# EAGLE design source_eagle (EAGLE 6.6.0)
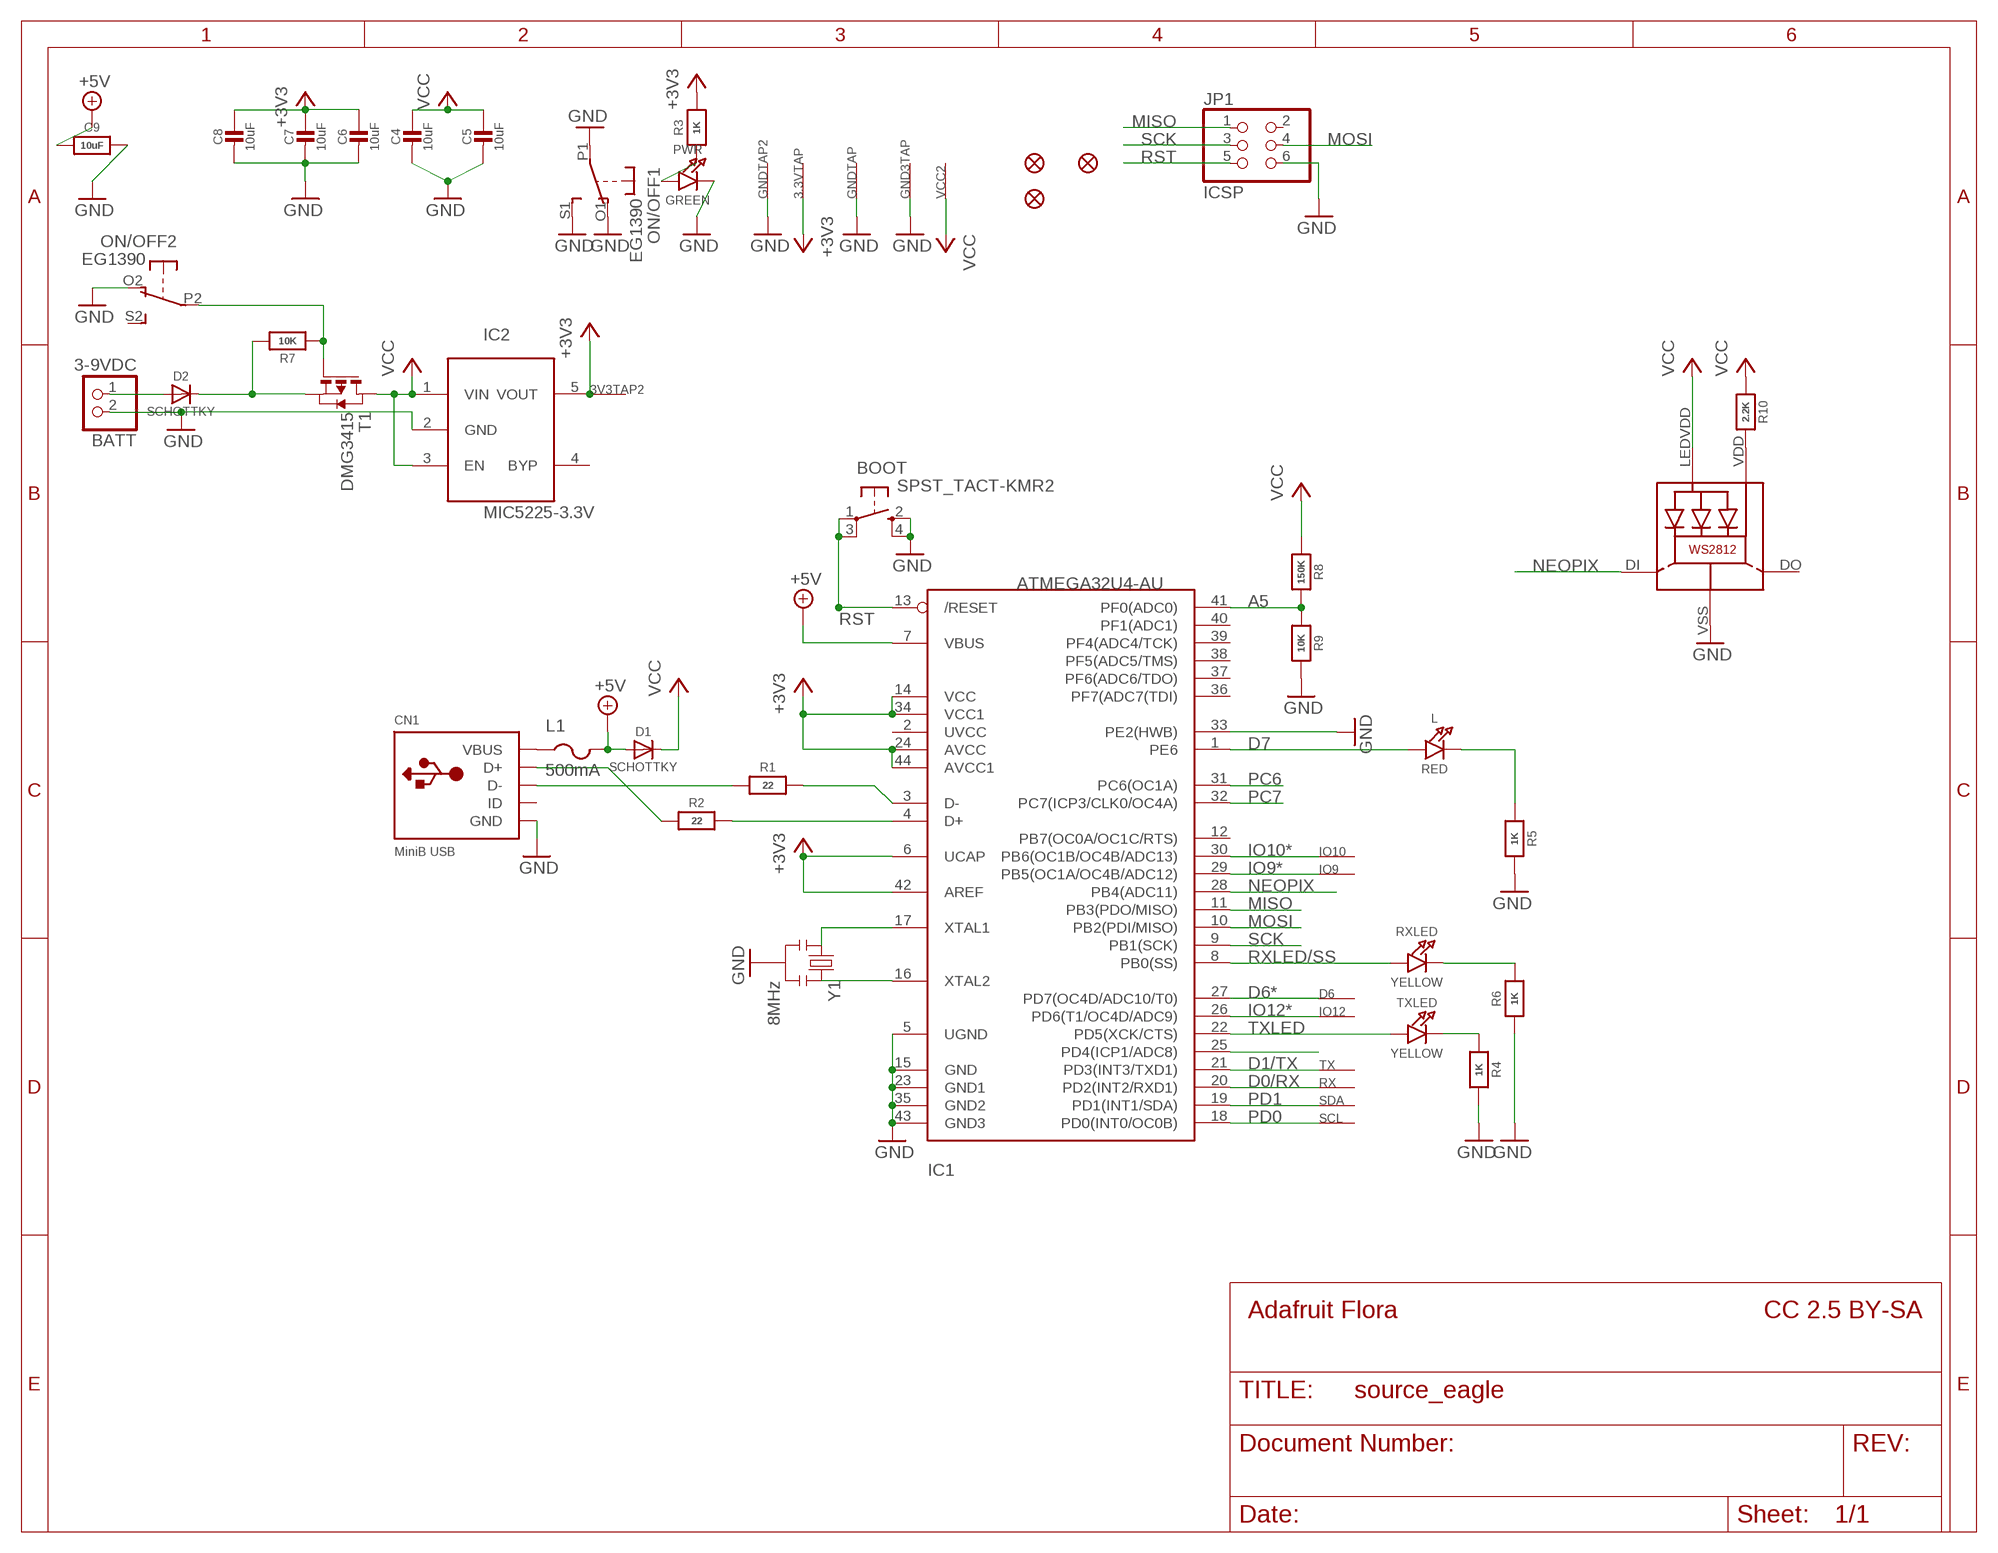
[diagram p0: schematic, sheet 1]

## Parts
3.3VTAP  SEWTAP-2.0IN  [SEWINGTAP_2.0]
3V3TAP2  SEWTAP-2.0IN  [SEWINGTAP_2.0]
BATT  3-9VDC  JST_2PIN-SMT-RA  [JST-PH-2-SMT-RA]
BOOT  SPST_TACT-KMR2  [KMR2]
C4  10uF  CAP_CERAMIC0805-NOOUTLINE  [0805-NO]
C5  10uF  CAP_CERAMIC0805-NOOUTLINE  [0805-NO]
C6  10uF  CAP_CERAMIC0805-NOOUTLINE  [0805-NO]
C7  10uF  CAP_CERAMIC0805-NOOUTLINE  [0805-NO]
C8  10uF  CAP_CERAMIC0805-NOOUTLINE  [0805-NO]
C9  10uF  RESISTOR_0805MP  [_0805MP]
CN1  MiniB USB  USBMICRO_20329  [4UCONN_20329]
D1  SCHOTTKY  DIODESOD-123  [SOD-123]
D2  SCHOTTKY  DIODESOD-123  [SOD-123]
D6  SEWTAP-2.0IN  [SEWINGTAP_2.0]
GND3TAP  SEWTAP-2.0IN  [SEWINGTAP_2.0]
GNDTAP  SEWTAP-2.0IN  [SEWINGTAP_2.0]
GNDTAP2  SEWTAP-2.0IN  [SEWINGTAP_2.0]
IC1  ATMEGA32U4-AU  [TQFP44]
IC2  MIC5225-3.3V  LP298XS  [SOT23-5L]
IO9  SEWTAP-2.0IN  [SEWINGTAP_2.0]
IO10  SEWTAP-2.0IN  [SEWINGTAP_2.0]
IO12  SEWTAP-2.0IN  [SEWINGTAP_2.0]
JP1  ICSP  PINHD-2X3  [2X03]
L  RED  LED0805_NOOUTLINE  [CHIPLED_0805_NOOUTLINE]
L1  500mA  PTCFUSE-1206  [R1206]
LED1  WS2812  [WS2812]
ON/OFF  EG1390  DPDT-EG1390  [EG1390]
PWR  GREEN  LED0805_NOOUTLINE  [CHIPLED_0805_NOOUTLINE]
R1  22  RESISTOR0805_NOOUTLINE  [0805-NO]
R2  22  RESISTOR0805_NOOUTLINE  [0805-NO]
R3  1K  RESISTOR_0805MP  [_0805MP]
R4  1K  RESISTOR_0805MP  [_0805MP]
R5  1K  RESISTOR0805_NOOUTLINE  [0805-NO]
R6  1K  RESISTOR0805_NOOUTLINE  [0805-NO]
R7  10K  RESISTOR_0805MP  [_0805MP]
R8  150K  RESISTOR0805_NOOUTLINE  [0805-NO]
R9  10K  RESISTOR0805_NOOUTLINE  [0805-NO]
R10  2.2K  RESISTOR0805_NOOUTLINE  [0805-NO]
RX  SEWTAP-2.0IN  [SEWINGTAP_2.0]
RXLED  YELLOW  LED0805_NOOUTLINE  [CHIPLED_0805_NOOUTLINE]
SCL  SEWTAP-2.0IN  [SEWINGTAP_2.0]
SDA  SEWTAP-2.0IN  [SEWINGTAP_2.0]
T1  DMG3415  PMOSSOT23  [SOT-23]
TX  SEWTAP-2.0IN  [SEWINGTAP_2.0]
TXLED  YELLOW  LED0805_NOOUTLINE  [CHIPLED_0805_NOOUTLINE]
U$2  FIDUCIAL""  [FIDUCIAL_1MM]
U$3  FIDUCIAL""  [FIDUCIAL_1MM]
U$6  FIDUCIAL""  [FIDUCIAL_1MM]
VCC2  SEWTAP-2.0IN  [SEWINGTAP_2.0]
Y1  8MHz  RESONATORSMD  [RESONATOR-SMD]

## Nets
+3V3: 3.3VTAP.P$1(SEW) 3V3TAP2.P$1(SEW) C6.1 C7.1 C8.1 IC1.6(UCAP) IC1.14(VCC) IC1.24(AVCC) IC1.34(VCC1) IC1.42(AREF) IC1.44(AVCC1) IC2.5(VOUT) R3.2
+5V: C9.1 D1.A IC1.7(VBUS) L1.2
A5: IC1.41(PF0(ADC0)) R8.2 R9.1
D0/RX: IC1.20(PD2(INT2/RXD1)) RX.P$1(SEW)
D1/TX: IC1.21(PD3(INT3/TXD1)) TX.P$1(SEW)
D6*: D6.P$1(SEW) IC1.27(PD7(OC4D/ADC10/T0))
D7: IC1.1(PE6) L.A
GND: BATT.2 BOOT.2(S) BOOT.4(S1) C4.2 C5.2 C6.2 C7.2 C8.2 C9.2 CN1.BASE@1(GND) CN1.BASE@2(GND) CN1.GND CN1.SPRT@1(GND) CN1.SPRT@2(GND) CN1.SPRT@3(GND) CN1.SPRT@4(GND) GND3TAP.P$1(SEW) GNDTAP2.P$1(SEW) GNDTAP.P$1(SEW) IC1.5(UGND) IC1.15(GND) IC1.23(GND1) IC1.33(PE2(HWB)) IC1.35(GND2) IC1.43(GND3) IC2.2(GND) JP1.6 LED1.VSS(GND) ON/OFF.O1(1:O) ON/OFF.O2(2:O) ON/OFF.P1(1:P) ON/OFF.S1(1:S) PWR.C R4.2 R5.2 R6.1 R9.2 Y1.2
IO9*: IC1.29(PB5(OC1A/OC4B/ADC12)) IO9.P$1(SEW)
IO10*: IC1.30(PB6(OC1B/OC4B/ADC13)) IO10.P$1(SEW)
IO12*: IC1.26(PD6(T1/OC4D/ADC9)) IO12.P$1(SEW)
MISO: IC1.11(PB3(PDO/MISO)) JP1.1
MOSI: IC1.10(PB2(PDI/MISO)) JP1.4
N$1: PWR.A R3.1
N$2: CN1.D+ R2.1
N$3: IC1.3(D-) R1.2
N$4: IC1.4(D+) R2.2
N$5: CN1.D- R1.1
N$6: D2.C R7.2 T1.2(S)
N$7: BATT.1 D2.A
N$8: IC1.17(XTAL1) Y1.1
N$9: IC1.16(XTAL2) Y1.3
N$10: L.C R5.1
N$11: R4.1 TXLED.C
N$12: R6.2 RXLED.C
N$13: ON/OFF.P2(2:P) R7.1 T1.3(G)
N$14: LED1.VDD R10.2
N$15: IC1.25(PD4(ICP1/ADC8))
NEOPIX: IC1.28(PB4(ADC11)) LED1.DI
PC6: IC1.31(PC6(OC1A))
PC7: IC1.32(PC7(ICP3/CLK0/OC4A))
PD0: IC1.18(PD0(INT0/OC0B)) SCL.P$1(SEW)
PD1: IC1.19(PD1(INT1/SDA)) SDA.P$1(SEW)
RST: BOOT.1(P) BOOT.3(P1) IC1.13(/RESET) JP1.5
RXLED/SS: IC1.8(PB0(SS)) RXLED.A
SCK: IC1.9(PB1(SCK)) JP1.3
TXLED: IC1.22(PD5(XCK/CTS)) TXLED.A
VBUS: CN1.VBUS L1.1
VCC: C4.1 C5.1 D1.C IC2.1(VIN) IC2.3(EN) LED1.LEDVDD R8.1 R10.1 T1.1(D) VCC2.P$1(SEW)
Unconnected: CN1.ID IC1.2(UVCC) IC1.12(PB7(OC0A/OC1C/RTS)) IC1.36(PF7(ADC7(TDI)) IC1.37(PF6(ADC6/TDO)) IC1.38(PF5(ADC5/TMS)) IC1.39(PF4(ADC4/TCK)) IC1.40(PF1(ADC1)) IC2.4(BYP) JP1.2 LED1.DO ON/OFF.S2(2:S)

## Notes on the sheet
- Adafruit Flora | CC 2.5 BY-SA

## Library data of the parts
3.3VTAP 3V3TAP2 D6 GND3TAP GNDTAP GNDTAP2 IO9 IO10 IO12 RX SCL SDA TX VCC2 = adafruit:SEWTAP
BATT = adafruit:JST_2PIN: JST 2-Pin Connectors of various flavors SMT-RA (S2B-PH-SM4) 4UConnector #17311 SMT (B2B-PH-SM4) THM-RA (S2B-PH) THM (B2B-PH)
BOOT = adafruit:SPST_TACT: SMT 6mm switch, EVQQ2 series http://www.ladyada.net/library/eagle
C4-C8 = microbuilder:CAP_CERAMIC: Ceramic Capacitors For new designs, use the packages preceded by an '_' character since they are more reliable: The following footprints should be used on most boards: _0402 - Standard footprint for regular board layouts _0603 - Standard footprint for regular board layouts _0805 - Standard footprint for regular board layouts _1206 - Standard footprint for regular board layouts For extremely tight-pitch boards where space is at a premium, the following 'micro-pitch' footprints can be used (smaller pads, no silkscreen outline, etc.): _0402MP - Micro-pitch footprint for very dense/compact boards _0603MP - Micro-pitch footprint for very dense/compact boards _0805MP - Micro-pitch footprint for very dense/compact boards _1206MP - Micro-pitch footprint for very dense/compact boards
C9 R1-R10 = microbuilder:RESISTOR: Resistors For new designs, use the packages preceded by an '_' character since they are more reliable: The following footprints should be used on most boards: _0402 - Standard footprint for regular board layouts _0603 - Standard footprint for regular board layouts _0805 - Standard footprint for regular board layouts _1206 - Standard footprint for regular board layouts For extremely tight-pitch boards where space is at a premium, the following 'micro-pitch' footprints can be used (smaller pads, no silkscreen outline, etc.): _0402MP - Micro-pitch footprint for very dense/compact boards _0603MP - Micro-pitch footprint for very dense/compact boards _0805MP - Micro-pitch footprint for very dense/compact boards _1206MP - Micro-pitch footprint for very dense/compact boards
CN1 = microbuilder:USB: USB Connectors USBMINIB - Surface Mount Female Mini-B USB Connector 4UConnector: 06564
D1 D2 = microbuilder:DIODE: Diode SMA Model Volts Amps Type Vf Ir Digikey # Notes SSA34-E3 40V 3A Schottky 480mV @ 3A 200uA @ 40V SSA34-E3/61TGITR-ND CDBA120-G 20V 1A Schottky 500mV @ 1A 500uA @ 20V 641-1014-6-ND REEL MBRA210 10V 2A Schottky 350mV @ 2A 700uA @ 10V MBRA210LT3 SOD-123 Model Volts Amps Type Vf Ir Order # Notes BAT54T1G 30V 200mA Schottky 800mV @ 200mA 2uA @ 25V BAT54T1GOSTR-ND B0530W 30V 500mA Schottky 430mV @ 500mA 130uA @ 30V B0530W-FDICT-ND REEL MBR120 20V 1A Schottky 340mV @ 1A MBR120VLSFT1GOSCT-ND SOD-323 Model Volts Amps Type Vf Ir Order # Notes PMEG2005EJ 20V 500mA Schottky 355mV @ 500mA 568-4110-1-ND ZLLS410 10V 570mA Schottky 380mV @ 570mA ZLLS410CT-ND 1N4148WS 75V 150mA Silicon/Simple 1V 1N4148WSFSCT-ND REEL SOD-523 Model Volts Amps Type Vf Ir Order # Notes BAT54XV2 30V 200mA Schottky 0.8V @ 100mA BAT54XV2CT-ND TB751S 30V 30mA Schottky RB751S-40TE61CT-ND SOT23-R/W (R = Solder Paste/Reflow Ovens, W = Hand-Soldering) Model Volts Amps Type Vf Ir Order # Notes BAT54FILM 40V 300mA Schottky 497-7162-1-ND POWERDI-5 Model Volts Amps Type Vf Ir Order # Notes PDS560 60V 5A Schottky 670mV @ 5A 150uA @ 60V PDS560DICT-ND
IC1 = adaprog:ATMEGA32U4
IC2 = adafruit:LP298X
JP1 = pinhead:PINHD-2X3: PIN HEADER
L PWR RXLED TXLED = microbuilder:LED: LED 0603 - 0603 Surface Mount Package 2mA: Green LED - Low Power (3.9mcd, 2ma, 1.7Vf) - Digikey: 475-2709-2-ND Orange LED - Low Power (9.8mcd, 2ma, 1.8Vf) - Digikey: 475-1194-2-ND Red LED - Low Power (5mcd, 2ma, 1.8Vf) - Digikey: 475-1195-2-ND Yellow LED - Low Power (7mcd, 2ma, 1.8Vf) - Digikey: 475-1196-2-ND 5mA: Blue LED - Low Power (17mcd, 5ma, 2.9Vf) - Digikey: LNJ937W8CRACT-ND 0805 - 0805 Surface Mount Package 2mA: Red LED (8.8mcd, 2mA, 1.8Vf, Clear) - Low Power [Digikey: 475-2510-1-ND] Green LED (5mcd, 2mA, 1.8Vf, Clear) - Low Power [Digikey: 475-2730-1-ND] Yellow LED (11.3mcd, 2mA, 1.8Vf, Clear) - Low Power [Digikey: 475-2555-1-ND] 20mA: Red LED (104mcd, 20mA, Diffused) - LS R976 [Digikey: 475-1278-6-ND] Red LED (12mcd, 20mA, 2.0Vf, Clear) - APT2012EC [Digikey: 754-1128-1-ND] Green LED (15mcd, 20mA, 2.2Vf, Clear) - APT2012GC [Digikey: 754-1131-1-ND] Orange LED (160mcd, 20mA, 2.1Vf, Clear) - APT2012SECK [Digikey: 754-1130-1-ND] 1206 - 1206 Surface Mount Package Green LED (26mcd, 20mA, Diffused) - LG N971 [Digikey: 475-1407-6-ND] Red LED (15mcd, 20mA, Diffused) - LH N974 [Digikey: 475-1416-6-ND] Cree - Cree High-Power Surface Mount LEDs XPEBWT-L1-0000-00D50 - White 111lm 350mA 2.9Vf 6200K 110° XTEAWT-00-0000-00000LEE3 - White 114lm 350mA 2.85Vf 5000K 115° Everlight - Everlight 45-21 Series Surface Mount LEDs 45-21/QK2C-B2832AC2CB2/2T - Warm White 2000mcd 20mA 3.25Vf 3050K 120° 45-21/LK2C-B38452C4CB2/2T - Nuetral White 2000mcd 20mA 3.25Vf 4150K 120° 45-21/LK2C-B50634C6CB2/2T - Cold White 2200mcd 20mA 3.25Vf 5650K 120° PLCC2 Reverse Mount LS T77K-J1L2-1-0-2-R18-Z - Red 11.25mcd 2mA 1.8Vf 630nm 120° LO T77K-L1M2-24-Z - Orange 19.6mcd 2mA 1.8Vf 606nm 120° LY T77K-K2M1-26-Z - Yellow 15.7mcd 2mA 1.8Vf 587nm 120°
L1 = adafruit:PTCFUSE: PTC fuses, resettable thermistors
LED1 = adafruit:WS2812
ON/OFF = adafruit:DPDT
T1 = zetex:PMOSSOT23: MOS FET; OC_FARNELL: unknown; OC_NEWARK: unknown
U$2 U$3 U$6 = microbuilder:FIDUCIAL: Fiducial Alignment Points Various fiducial points for machine vision alignment.; BOM: EXCLUDE
Y1 = SparkFun:RESONATOR: Resonator Small SMD resonator. This is the itty bitty 10/20MHz resonators with built in caps. CSTCE10M0G55 and CSTCE20M0V53. Footprint has been reviewed closely but hasn't been tested yet.

## Board
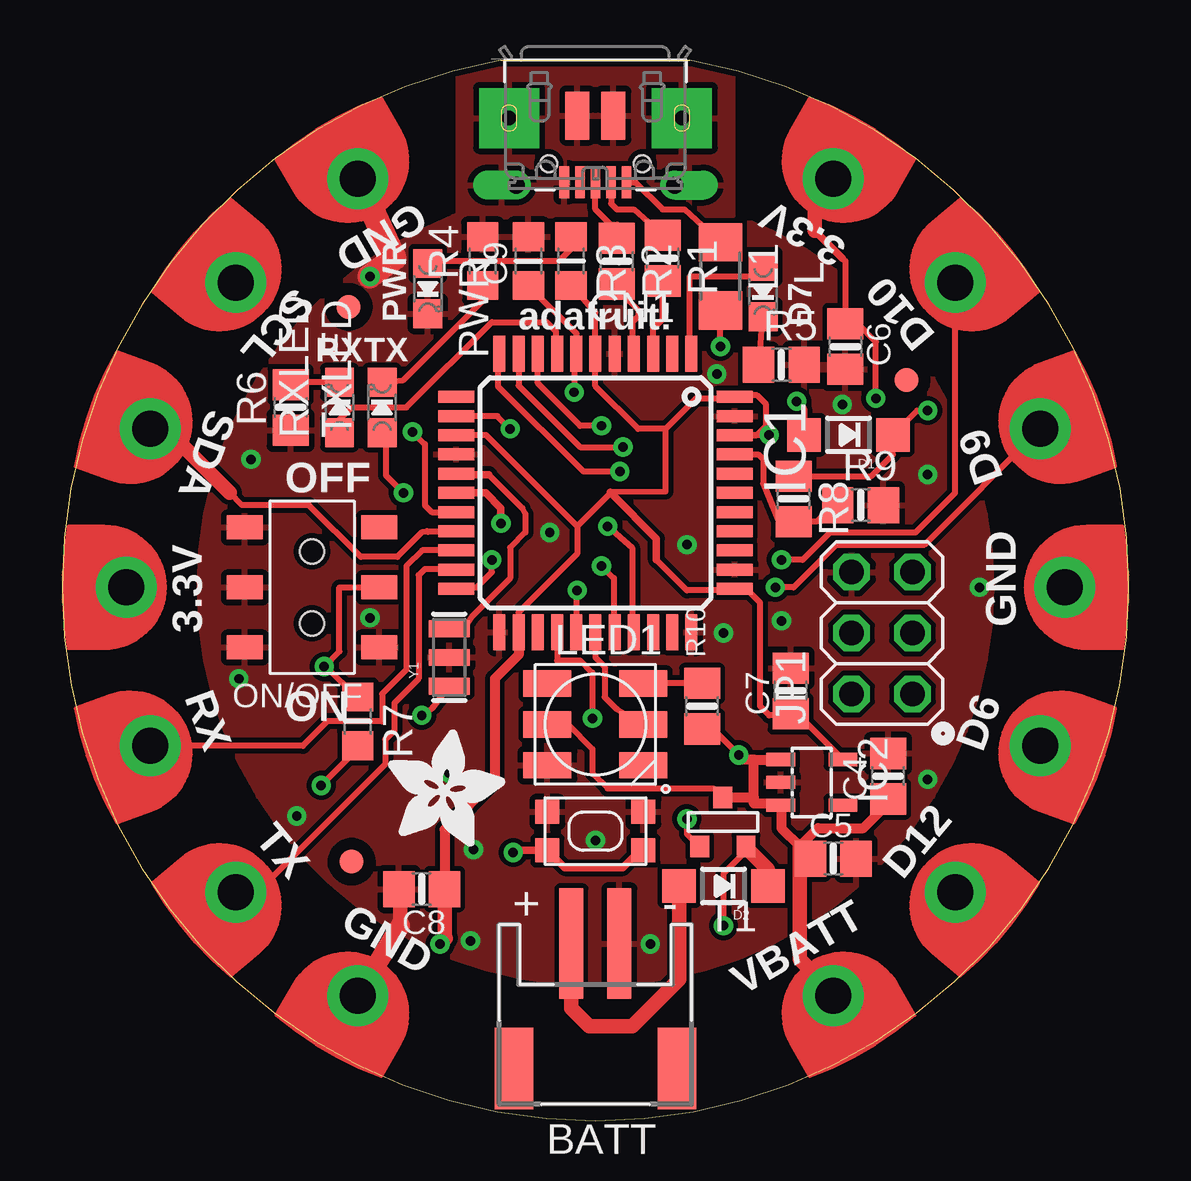
[diagram p1: board, top side]
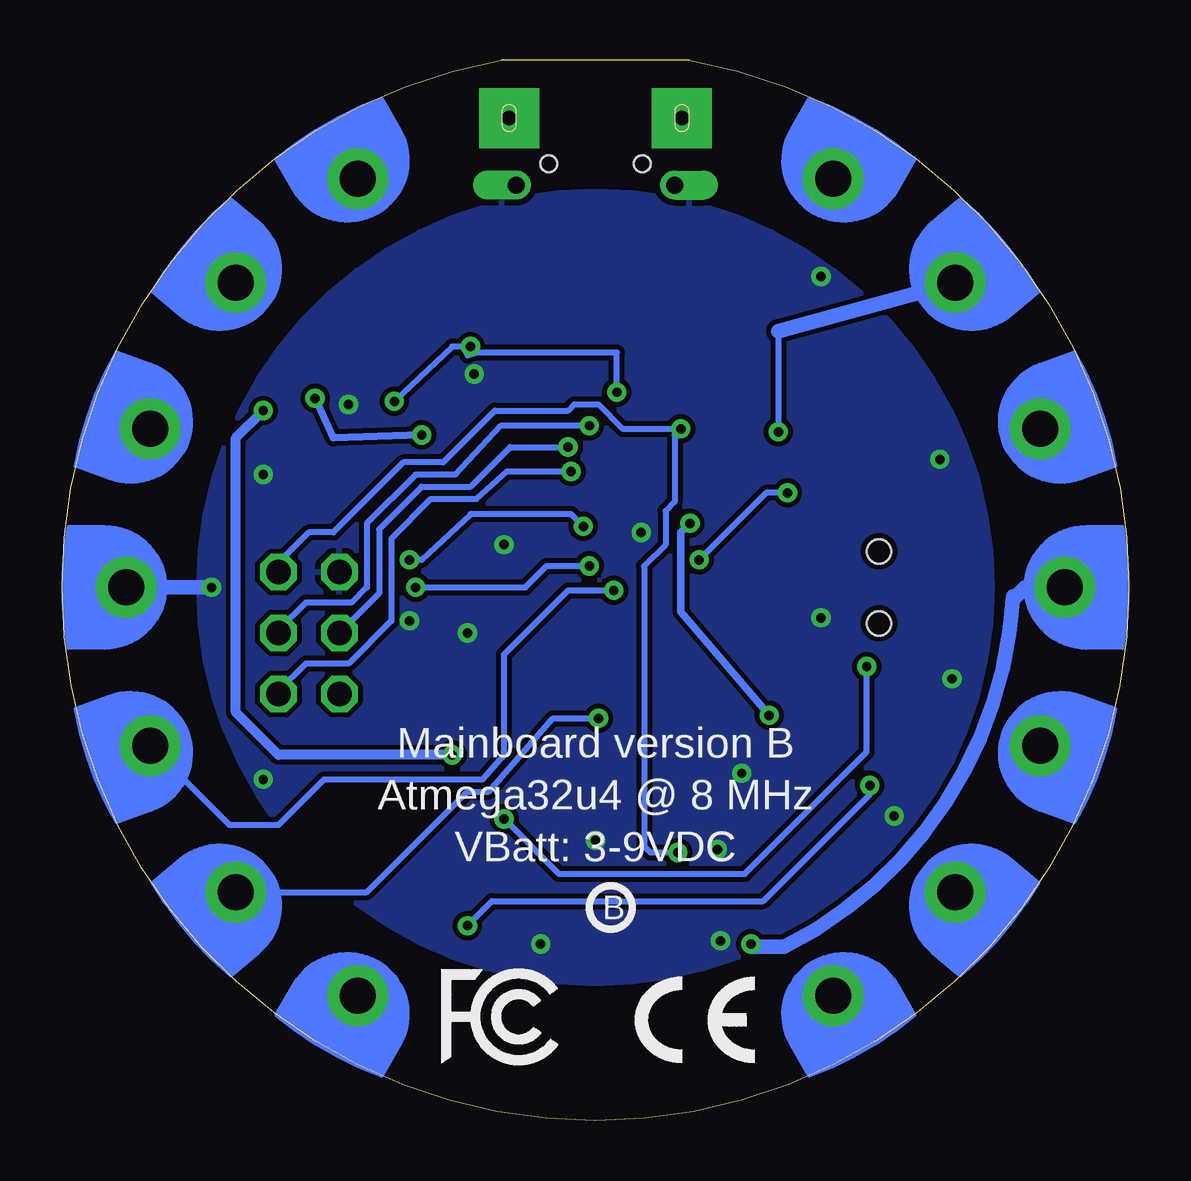
[diagram p2: board, bottom side, seen from below]

Size 44.45 x 44.2 mm. Coordinates in mm from the lower left corner, seen from the top.
Outline: 0,22.23 arc90 22.23,0 arc90 44.45,22.23 arc80 26.16,44.2 18.29,44.2 arc80 0,22.23
Copper layers (1*16): Top 0.035mm / dielectric 1.5mm / Bottom 0.035mm
Design rules "adafruit": minimum track width 8mil, minimum drill 15.5mil, track to track 8mil, track to pad 8mil, pad to pad 8mil, via to via 8mil, smd to smd 8mil, copper to edge 10mil, drill to drill 8mil, minimum pad ring 10mil, minimum via ring 8mil, stop-mask expansion 2mil, vias tented up to drill 20mil, thermal gap 10mil

### Footprints (pad centres in the part's own frame; a part is rotated, then mirrored left to right if it is on the bottom)
SEWINGTAP_2.0 = drill 1.5 pad 2.54: P$1 0,0
JST-PH-2-SMT-RA = smd 1 x 4.6: 1 1,-3.7; 2 -1,-3.7 | smd 1.6 x 3.4: NC1 -3.4,1.5; NC2 3.4,1.5
KMR2 = smd 1 x 1: 1 2,0.8; 2 2,-0.8; 3 -2,0.8; 4 -2,-0.8
0805-NO = smd 1.3 x 1.5: 1 -0.95,0; 2 0.95,0
_0805MP = smd 1.2 x 1.3: 1 -1.016,0; 2 1.016,0
4UCONN_20329 = smd 1 x 2: BASE@1 -0.75,-2; BASE@2 0.75,-2 | smd 0.4 x 1.35: D+ 0,0.775; D- -0.65,0.775; GND 1.3,0.775; ID 0.65,0.775; VBUS -1.3,0.775 | drill 0.7 offset: SPRT@1 -3.3,0.9; SPRT@2 3.3,0.9 | drill 0.6 pad 2.5 square: SPRT@3 -3.6,-1.9; SPRT@4 3.6,-1.9 | hole 0.7: -1.95,0; 1.95,0
SOD-123 = smd 1.4 x 1.4: A 1.85,0; C -1.85,0
TQFP44 = smd 1.5 x 0.5: 1 -5.8,4; 2 -5.8,3.2; 3 -5.8,2.4; 4 -5.8,1.6; 5 -5.8,0.8; 6 -5.8,0; 7 -5.8,-0.8; 8 -5.8,-1.6; 9 -5.8,-2.4; 10 -5.8,-3.2; 11 -5.8,-4; 23 5.8,-4; 24 5.8,-3.2; 25 5.8,-2.4; 26 5.8,-1.6; 27 5.8,-0.8; 28 5.8,0; 29 5.8,0.8; 30 5.8,1.6; 31 5.8,2.4; 32 5.8,3.2; 33 5.8,4 | smd 0.5 x 1.5: 12 -4,-5.8; 13 -3.2,-5.8; 14 -2.4,-5.8; 15 -1.6,-5.8; 16 -0.8,-5.8; 17 0,-5.8; 18 0.8,-5.8; 19 1.6,-5.8; 20 2.4,-5.8; 21 3.2,-5.8; 22 4,-5.8; 34 4,5.8; 35 3.2,5.8; 36 2.4,5.8; 37 1.6,5.8; 38 0.8,5.8; 39 0,5.8; 40 -0.8,5.8; 41 -1.6,5.8; 42 -2.4,5.8; 43 -3.2,5.8; 44 -4,5.8
SOT23-5L = smd 0.55 x 1.2: 1 -0.95,-1.3; 2 0,-1.3; 3 0.95,-1.3; 4 0.95,1.3; 5 -0.95,1.3
2X03 = drill 1.016 octagon: 1 -2.54,-1.27; 2 -2.54,1.27; 3 0,-1.27; 4 0,1.27; 5 2.54,-1.27; 6 2.54,1.27
CHIPLED_0805_NOOUTLINE = smd 1.2 x 1.2: A 0,-1.05; C 0,1.05
R1206 = smd 1.6 x 1.803: 1 -1.422,0; 2 1.422,0
WS2812 = smd 2 x 1.1: DI 2,0; DO 2,-1.7; LEDVDD -2,0; NC -2,1.7; VDD 2,1.7; VSS -2,-1.7
EG1390 = smd 1 x 1.5: O1 -2.5,2.8; O2 -2.5,-2.8; P1 0,2.8; P2 0,-2.8; S1 2.5,2.8; S2 2.5,-2.8 | hole 1: 1.5,0; -1.5,0
SOT-23 = smd 0.787 x 0.889: 1 0.025,-1.016; 2 -0.94,1.016; 3 0.991,1.016
FIDUCIAL_1MM = smd 1 x 1: 1 0,0
RESONATOR-SMD = smd 0.7 x 1.7: 1 -1.2,0; 2 0,0; 3 1.2,0

### Placement (x,y rotation side)
3.3VTAP  2.67,22.23 90 top
3V3TAP2  32.13,39.24 330 top
BATT  22.23,3.68 180 top
BOOT  22.23,12.07 180 top
C4  34.42,14.35 90 top
C5  32.13,10.92 0 top
C6  32.64,32.26 270 top
C7  30.35,17.91 90 top
C8  14.99,9.65 180 top
C9  19.43,35.81 90 top
CN1  22.23,39.88 180 top
D1  32.77,28.58 180 top
D2  27.56,9.78 180 top
D6  40.77,15.62 250 top
GND3TAP  12.32,39.24 30 top
GNDTAP  41.78,22.23 270 top
GNDTAP2  12.32,5.21 150 top
IC1  22.23,26.16 270 top
IC2  31.24,14.1 270 top
IO9  40.77,28.83 290 top
IO10  37.21,34.92 310 top
IO12  37.21,9.53 230 top
JP1  34.16,20.32 90 top
L  29.21,34.54 180 top
L1  27.43,35.18 270 top
LED1  22.23,16.51 0 top
ON/OFF  10.41,22.23 90 top
PWR  15.24,34.67 180 top
R1  25.02,35.94 270 top
R2  23.11,35.81 270 top
R3  21.21,35.81 270 top
R4  17.53,35.81 90 top
R5  29.97,31.5 0 top
R6  9.53,29.72 90 top
R7  12.32,16.64 270 top
R8  30.48,25.91 270 top
R9  33.27,25.65 0 top
R10  26.67,17.27 90 top
RX  3.68,15.62 110 top
RXLED  11.56,29.72 0 top
SCL  7.24,34.92 50 top
SDA  3.68,28.83 70 top
T1  27.56,12.45 180 top
TX  7.24,9.53 130 top
TXLED  13.34,29.72 0 top
U$1  [ADAFRUIT_5MM]  13.59,11.43 0 top
U$2  12.07,10.8 0 top
U$3  11.94,33.91 0 top
U$4  [FLORAMED]  33.91,24.13 0 bottom
U$5  [PCBFEAT-REV-040]  21.59,8.89 0 bottom
U$6  35.18,30.86 0 top
U$7  [SYMBOL_FCC_5MM]  28.7,2.29 0 bottom
U$8  [SYMBOL_CE_5MM]  20.57,2.41 0 bottom
VCC2  32.13,5.21 210 top
Y1  16.13,19.3 90 top

### Tracks (layer width: path | path; a pad name or v marks a point on that pad's centre or on a via)
+3V3  (via drill 0.39)
  Top 0.254: IC1.14 17.67,28.56 21.46,24.77 | IC1.24 19.03,21.18 21.46,23.62 21.46,24.77 | 24.77,23.37 26.04,22.1 28.07,22.1 | 28.07,22.1 28.03,22.14 IC1.34 | 28.07,22.1 28.07,22.12 IC1.34 | 25.15,28.83 24,28.83 22.23,30.61 IC1.6 22.23,33.67 21.35,34.67 21.35,34.78 R3.2 | 25.15,28.83 26.42,30.1 28.07,30.1 28.07,30.12 IC1.44 28.09,30.23 28.96,30.23 29.34,29.85 29.34,28.96 28.94,28.56 IC1.42 28.04,28.58 v29.46,28.58 | 25.15,28.83 25.15,26.21 22.84,26.19 | 32.51,35.94 32.64,35.81 C6.1 33.15,33.21 33.91,32.45 v33.91,30.1 | 28.07,22.1 28.19,22.1 28.32,22.23 | IC2.5 30.63,16.96 C7.1 | 21.46,24.77 22.8,26.1 22.92,26.1 | 30.35,16.89 29.46,16.89 29.08,17.27 29.08,21.59 28.58,22.1 28.09,22.1 IC1.34
  Top 0.305: 22.84,26.19 22.92,26.1 24.77,24.26 24.77,23.37 | 32.51,35.94 31.37,37.08
  Top 0.406: 30.35,16.89 C7.1 | IC1.24 19.03,19.41 18.03,18.42 18.03,14.22 15.94,12.13 C8.1
  Top 0.61: 3V3TAP2.P$1 31.37,38.48 31.37,37.08 | 16,9.78 16,9.65 C8.1 15.94,7.65 15.99,7.6 v15.75,7.37
  Bottom 0.305: v29.46,28.58 33.15,28.45 v33.91,30.1
  Bottom 0.61: 3.3VTAP.P$1 4.32,22.23 4.83,21.72 4.83,21.84 arc60 14.35,7.24 15.75,7.24 v15.75,7.37
+5V  (via drill 0.39)
  Top 0.254: v27.43,32.26 L1.2 | v21.34,30.35 21.34,31.96 IC1.7 21.43,32.8 C9.1 | 30.61,28.83 D1.A 30.92,29.66 v30.61,29.97
  Bottom 0.254: v21.34,30.35 21.34,32 27.18,32 27.56,31.88 v27.43,32.26 28.19,32.26 v30.61,29.97
A5
  Top 0.254: R9.1 32.13,25.65 31.44,24.96 R8.2 30.42,25.02 29.85,25.02 29.21,26.54 29.21,27.56 29.01,27.76 IC1.41
D0/RX
  Top 0.254: IC1.20 15,23.76 14.35,23.11 14.35,18.8 13.34,17.78 13.34,16.64 11.05,16.64 10.03,15.62 RX.P$1
  Top 0.61: 3.81,15.49 RX.P$1
D1/TX
  Top 0.254: IC1.21 16.41,22.96 16.38,22.99 15.11,22.99 14.86,22.73 14.86,18.42 13.84,17.4 13.84,16.26 13.46,15.88 13.46,14.86 8.13,9.53 TX.P$1 | 8,10.54 8,10.29
  Top 0.61: 8,10.29 TX.P$1
D6*  (via drill 0.39)
  Top 0.254: IC1.27 21.43,22.14 v21.46,22.1
  Bottom 0.254: v21.46,22.1 23.37,22.1 26.04,19.43 26.04,15.24 26.92,14.22 33.53,14.22 35.43,12.32 37.47,12.32 D6.P$1 40.89,15.62
D7
  Top 0.254: IC1.1 26.18,32 26.16,32 26.16,35.18 28.83,35.18 L.A
GND  (via drill 0.39)
  Top 0.61: 14.1,8 14.1,8.13 14.1,9.65 C8.2 | GND3TAP.P$1 13.21,39.24
  Top 0.813: GNDTAP2.P$1 14.1,8.13
  Top 1.016: GND3TAP.P$1 13.84,35.94 v12.83,35.18
  Bottom 0.61: 38.48,22.23 GNDTAP.P$1
  other vias: 7.87,27.56 9.78,12.7 17.02,7.49 20.32,24.51 38.23,22.23 36.07,14.22 26.04,24 36.07,26.92 12.83,20.96 7.37,18.42 16.13,14.48 22.23,11.68 24.51,7.37 27.28,31.12 32.51,29.85 27.56,20.32 29.97,20.83 17.15,11.3
  pour Top: 22.23,5.71 arc90 38.73,22.23 arc90 22.23,38.73 arc90 5.71,22.23 arc90
  pour Bottom: 22.23,5.71 arc90 38.73,22.23 arc90 22.23,38.73 arc90 5.71,22.23 arc90
  pour Top: 16.51,44.07 16.51,37.72 27.94,37.72 27.94,44.07
IO9*  (via drill 0.39)
  Top 0.254: IO9.P$1 35.94,24 32.26,24 30.48,22.23 v29.72,22.23 | 22.99,20.45 23.11,20.19 | 22.99,20.45 IC1.29 | v22.48,23.11 22.99,22.61 22.99,20.45
  Bottom 0.254: v29.72,22.23 25.15,22.23 24.26,23.11 v22.48,23.11
IO10*  (via drill 0.39)
  Top 0.254: IO10.P$1 37.21,26.16 35.56,24.51 32,24.51 30.86,23.37 v29.97,23.37 | IC1.30 23.75,20.44 23.75,23.88 v22.73,24.77
  Bottom 0.254: v22.73,24.77 23.24,25.27 27.43,25.27 29.46,23.37 v29.97,23.37
IO12*  (via drill 0.39)
  Top 0.254: IC1.26 20.62,19.18 21.59,19.18 22.1,18.67 v22.1,16.76
  Bottom 0.254: v22.1,16.76 24,16.76 26.67,13.72 27.56,13.72 31.75,9.53 IO12.P$1
MISO  (via drill 0.39)
  Top 0.254: IC1.11 18.18,32 18.16,32 18.16,30.61 21.72,27.05 v23.24,27.05
  Bottom 0.254: JP1.1 35.43,17.91 34.29,19.05 32.51,19.05 30.73,20.83 30.73,24.26 29.08,25.91 27.18,25.91 25.91,27.05 v23.24,27.05
MOSI  (via drill 0.39)
  Top 0.254: IC1.10 19.03,30.63 21.59,28.07 v23.37,28.07
  Bottom 0.254: JP1.4 31.24,21.97 31.24,24.64 29.46,26.42 27.43,26.42 25.78,28.07 v23.37,28.07
N$1
  Top 0.254: R3.1 21.21,36.32 20.7,35.81 15.4,35.81 PWR.A
N$2
  Top 0.254: CN1.D+ 22.23,37.97 22.86,37.34 23.11,37.34 R2.1
N$3
  Top 0.254: 24.62,34.72 R1.2 25.02,33.4 24.62,33.01 IC1.3
N$4
  Top 0.254: R2.2 23.37,34.61 23.37,34.42 24,33.78 24,33.53 23.75,33.27 23.75,32.04 IC1.4
N$5
  Top 0.254: R1.1 24.89,36.96 | 24.89,37.34 R1.1 | CN1.D- 22.88,38.21 23.11,37.97 23.81,37.97 R1.1
N$6  (via drill 0.39)
  Top 0.254: 27.56,9.91 27.53,9.91 | 27.56,9.91 v27.56,8.13 | 27.56,9.91 27.56,10.29 28.58,11.3 | v10.8,13.97 12.32,15.49 R7.2
  Top 0.61: 29.46,9.78 D2.C 29.41,10.47 28.58,11.3 28.5,11.38 T1.2
  Bottom 0.254: v27.56,8.13 26.54,9.14 15.24,9.14 10.8,13.59 v10.8,13.97
N$7
  Top 0.61: BATT.1 21.23,4.68 21.97,3.94 23.75,3.94 25.71,5.9 D2.A
N$8  (via drill 0.39)
  Top 0.254: v14.99,16.89 15.44,17.22 Y1.1
  Top 0.305: v18.29,24.89 18.29,25.53 17.65,26.16 IC1.17
  Bottom 0.305: v14.99,16.89 18.67,21.21 18.67,24.51 v18.29,24.89
N$9
  Top 0.254: 17.78,26.92 19.18,25.53 19.3,25.27 19.3,24.51 18.67,23.88 18.67,22.61 17.11,21.05 16.73,20.49 Y1.3
  Top 0.305: IC1.16 16.47,26.96 16.51,26.92 17.78,26.92
N$10
  Top 0.254: L.C 29.16,33.31 29.16,33.26 R5.1
N$11
  Top 0.254: 13.37,30.73 TXLED.C 14.22,30.86 17.53,34.16 R4.1
N$12
  Top 0.254: RXLED.C 9.56,30.77
  Top 0.305: R6.2 9.53,30.73 9.56,30.77
N$13  (via drill 0.39)
  Top 0.254: 12.7,22.23 11.56,22.23 11.56,19.56 v10.92,18.92 10.98,18.92 R7.1 | T1.3 26.54,11.43 26.04,11.94 v26.04,12.57
  Top 0.406: 12.7,22.23 ON/OFF.P2
  Bottom 0.254: v26.04,12.57 23.75,10.29 16,10.29 10.92,15.37 v10.92,18.92
N$14
  Top 0.254: R10.2 24.24,18.22 LED1.VDD
NEOPIX
  Top 0.254: IC1.28 22.23,19.3 22.61,18.92 22.61,17.65 23.11,17.15 LED1.DI
PD0  (via drill 0.39)
  Top 0.254: IC1.18 15.41,25.36 15.11,25.65 15.11,28.19 v14.61,28.7
  Bottom 0.254: 14.61,32.89 v14.61,28.7
  Bottom 0.61: SCL.P$1 14.61,32.89
PD1
  Top 0.254: 6.99,26.16 7.49,25.65 10.29,25.65 12.45,23.5 13.97,23.5 14.99,24.51 15.24,24.54 15.22,24.56 IC1.19
  Top 0.61: SDA.P$1 3.68,28.7 4.45,28.7 6.99,26.16
RST  (via drill 0.39)
  Top 0.254: IC1.13 18.14,29.36 v18.67,28.83 | v18.8,11.18 18.92,11.3
  Top 0.305: BOOT.1 20.95,10.54 23.37,10.54 24.09,11.27 BOOT.3 24.26,11.27 24.26,11.18 | BOOT.1 20.07,11.27 | BOOT.1 18.8,11.27 v18.8,11.18
  Top 0.406: 20.07,11.27 20.07,11.43
  Bottom 0.254: JP1.5 35.56,22.73 35.56,23.11 34.16,24.51 33.15,24.51 30.23,27.43 28.58,27.43 26.42,29.59 23.37,29.59 23.11,29.85 22.1,29.85 21.08,28.83 v18.67,28.83 | v18.67,28.83 18.67,29.08 | v18.67,28.83 18.92,28.58 18.92,25.78 19.3,25.4 19.3,24 20.19,23.11 20.19,11.43 19.94,11.18 v18.8,11.18
RXLED/SS
  Top 0.254: 20.57,32.01 20.57,32.89 20.19,33.27 17.91,33.27 14.35,29.72 12.07,29.72 11.56,29.21 RXLED.A
  Top 0.305: 20.57,32.01 IC1.8
SCK  (via drill 0.39)
  Top 0.254: IC1.9 19.83,30.72 21.59,28.96 v22.48,28.96
  Bottom 0.254: JP1.3 35.43,20.45 34.29,21.59 32.39,21.59 31.75,22.23 31.75,24.89 29.72,26.92 28.07,26.92 26.16,28.96 v22.48,28.96
TXLED  (via drill 0.39)
  Top 0.254: TXLED.A 13.5,28.67 | 13.5,28.67 13.46,28.7 | IC1.22 16.38,22.2 16.38,22.23 17.27,22.23 17.91,22.86 v17.91,23.37 | 13.5,28.67 13.5,26.89 v14.22,26.16
  Bottom 0.254: v17.91,23.37 15.11,26.16 v14.22,26.16
VBUS
  Top 0.254: CN1.VBUS 23.89,39.1 25.02,37.97 25.93,37.97 L1.1
  Top 0.305: 27.43,36.32 L1.1
VCC  (via drill 0.39)
  Top 0.254: 30.73,11.05 31.05,11.05 C5.1 | 29.97,13.21 29.94,13.18 IC2.3 | R8.1 33.72,26.86 34.62,27.76 D1.C 35.63,29.59 v36.07,29.59 | R10.1 27.11,16.32 v28.19,15.24 | LED1.LEDVDD 21.08,16.51 22.1,15.49 22.1,14.48 22.73,13.84 27.15,13.84 T1.1
  Top 0.406: 28.83,15.05 28.19,15.05 v28.19,15.24 | 28.83,15.05 IC2.1 | 30.1,13.21 29.97,13.21 | 29.97,13.21 28.83,13.21 28.83,13.46 | 28.83,13.46 28.83,15.05 | 29.97,13.21 29.97,12.19 30.73,11.43 31.5,12.19 33.39,12.19 34.42,13.22 C4.1 | 28.83,13.46 T1.1
  Top 0.61: VCC2.P$1 32.13,5.33 30.73,6.73 30.73,11.05 30.73,11.43
  Bottom 0.406: v28.19,15.24 35.43,15.24 37.21,17.02 37.21,28.45 v36.07,29.59

### Text on the board
tPlace: GND | 3.3V | SCL | D7 | PWR | adafruit! | D10 | RX | TX | SDA | D9 | OFF | 3.3V | GND | D6 | RX | ON | D12 | TX | VBATT | GND
bPlace: Mainboard version B | Atmega32u4 @ 8 MHz | VBatt: 3-9VDC